# Altium schematic sheet PAGE05_ISO_RELAYS.SchDoc
size 386 x 246 mm
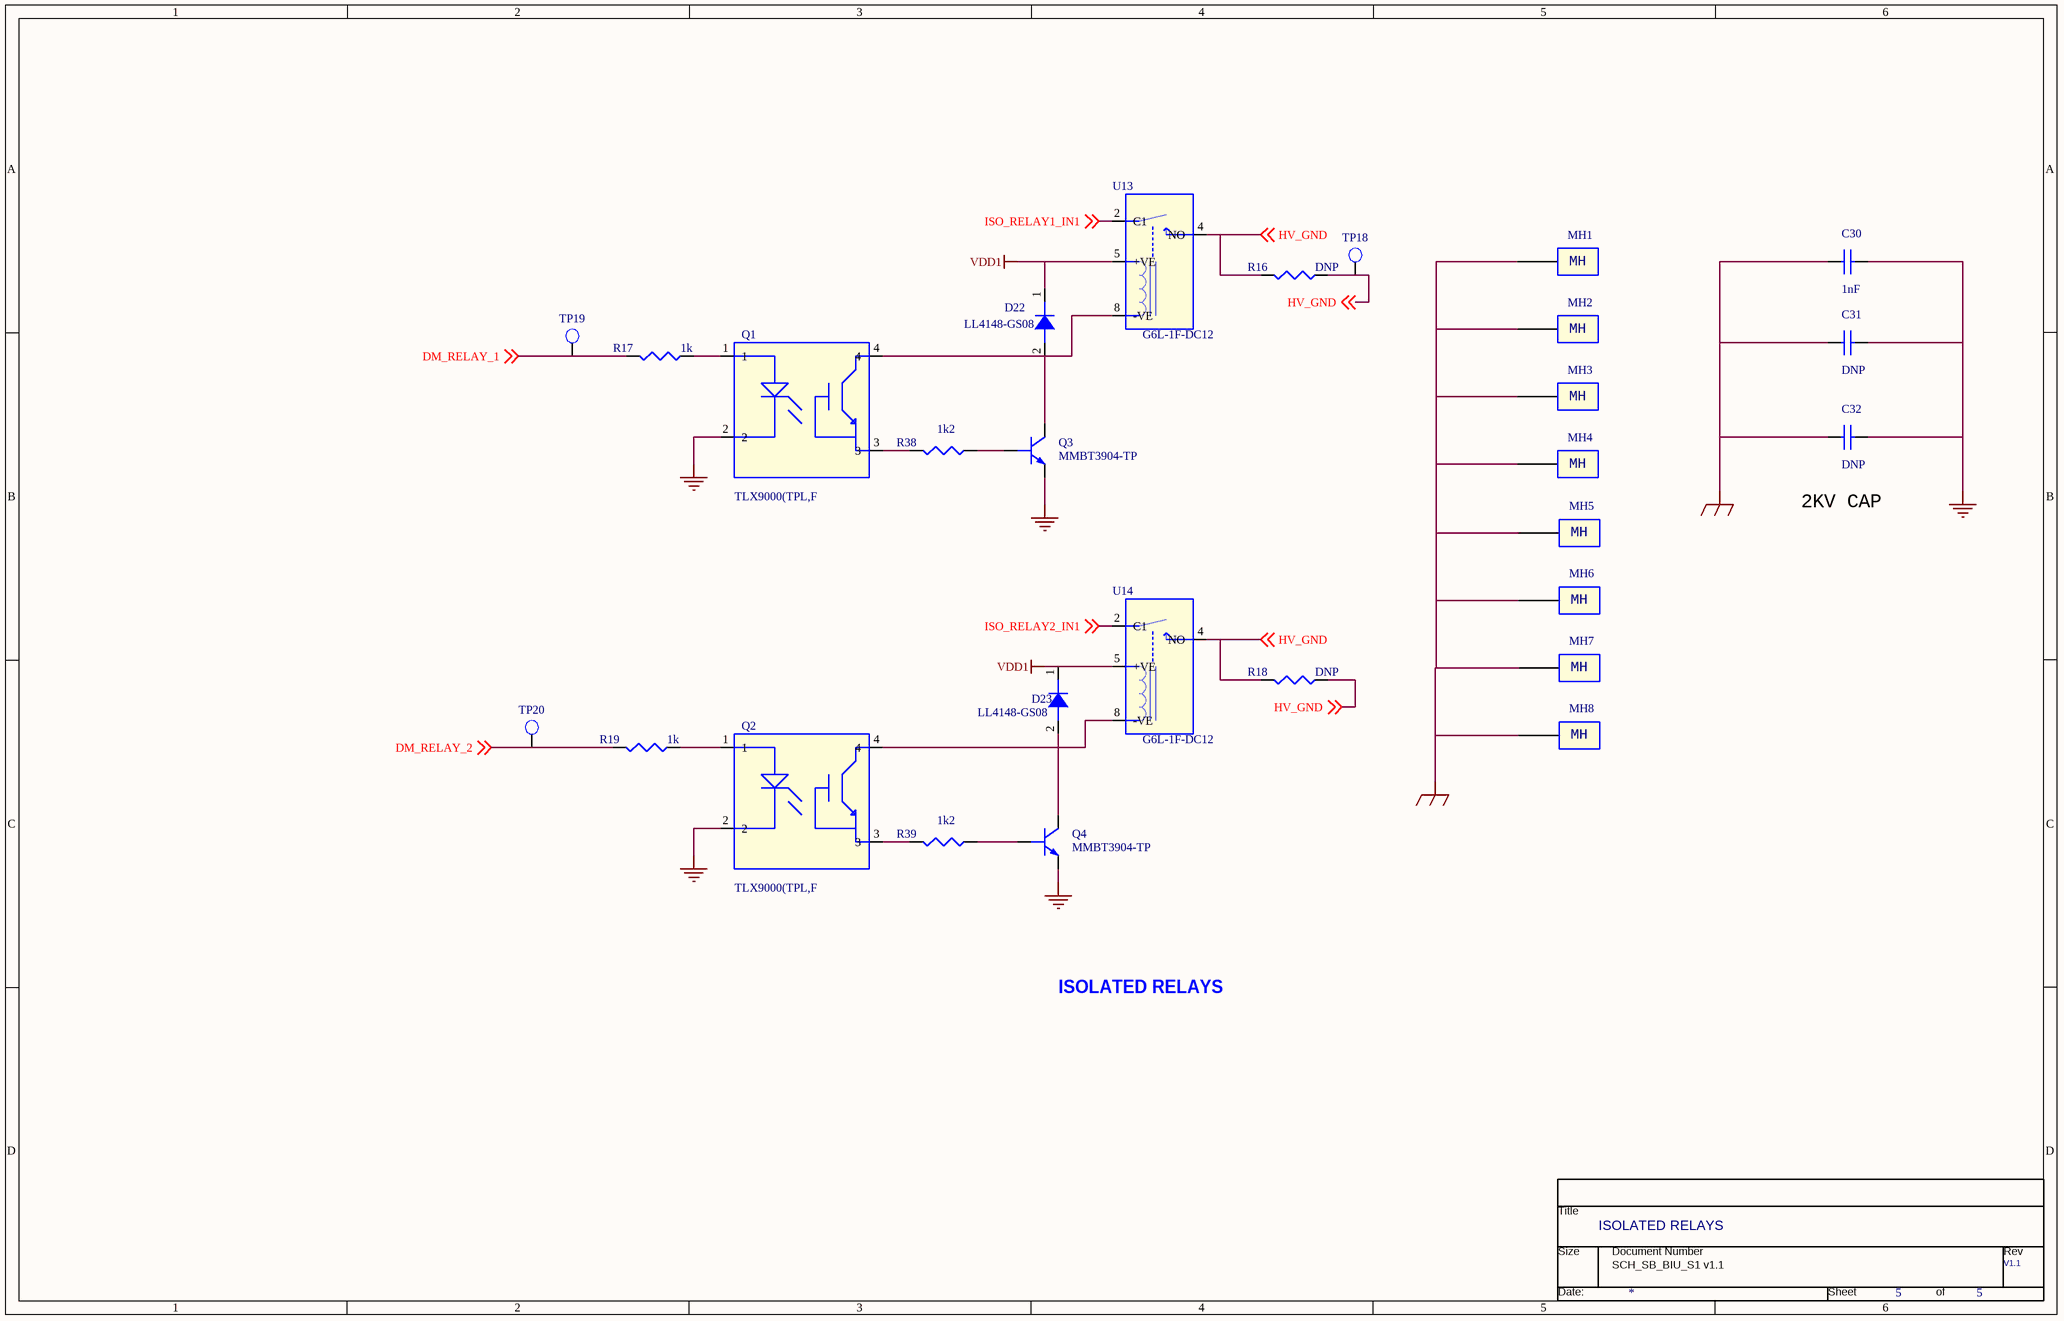
[diagram p0: PAGE05_ISO_RELAYS.SchDoc]

## Parts
*  Page Count: 5  Title: ISOLATED RELAYS  RevCode: V1.1  (hidden comment: TitleBlock0)  (graphical)
C30  1nF  [CAPC3216X180N_D]
C31  DNP  [CAPC3216X180N_D]
C32  DNP  [CAPC3216X180N_D]
D22  LL4148-GS08  [DIOMELF3515N]
D23  LL4148-GS08  [DIOMELF3515N]
MH1  Mounting hole  [MTG320_620]  (value not drawn)
MH2  Mounting hole  [MTG320_620]  (value not drawn)
MH3  Mounting hole  [MTG320_620]  (value not drawn)
MH4  Mounting hole  [MTG320_620]  (value not drawn)
MH5  Mounting hole  [MTG320_620]  (value not drawn)
MH6  Mounting hole  [MTG320_620]  (value not drawn)
MH7  Mounting hole  [MTG320_620]  (value not drawn)
MH8  Mounting hole  [MTG320_620]  (value not drawn)
Q1  TLX9000(TPL,F  [OPTO_TLP293_BL-TPL_E]
Q2  TLX9000(TPL,F  [OPTO_TLP293_BL-TPL_E]
Q3  MMBT3904-TP  [SOT95P237X122-3N_OSI]
Q4  MMBT3904-TP  [SOT95P237X122-3N_OSI]
R16  DNP  [RESC1608X55N_A]
R17  1k  [RESC1608X55N_A]
R18  DNP  [RESC1608X55N_A]
R19  1k  [RESC1608X55N_A]
R38  1k2  [RESC1608X55N_A]
R39  1k2  [RESC1608X55N_A]
TP18  T POINT R  [TPC160H100]  (value not drawn)
TP19  T POINT R  [TPC160H100]  (value not drawn)
TP20  T POINT R  [TPC160H100]  (value not drawn)
U13  G6L-1F-DC12  [RELAY_G6L-1F-DC12]
U14  G6L-1F-DC12  [RELAY_G6L-1F-DC12]

## Nets
CHASSIS_GND: C30.1 C31.1 C32.1 MH1.1 MH2.1 MH3.1 MH4.1 MH5.1 MH6.1 MH7.1 MH8.1
GND: C30.2 C31.2 C32.2 Q1.2 Q2.2 Q3.3(E) Q4.3(E)
VDD1: D22.1(K) D23.1(K) U13.5(+VE) U14.5(+VE)
DM_RELAY_1: R17.2 TP19.1(TP) ; off-sheet DM_RELAY_1
DM_RELAY_2: R19.2 TP20.1(TP) ; off-sheet DM_RELAY_2
HV_GND: R16.1 R16.2 R18.1 R18.2 TP18.1(TP) U13.4(NO) U14.4(NO) ; off-sheet HV_GND
ISO_RELAY1_IN1: U13.2(C1) ; off-sheet ISO_RELAY1_IN1
ISO_RELAY2_IN1: U14.2(C1) ; off-sheet ISO_RELAY2_IN1
NetD22_2: D22.2(A) Q1.4 Q3.2(C) U13.8(-VE)
NetD23_2: D23.2(A) Q2.4 Q4.2(C) U14.8(-VE)
NetQ1_1: Q1.1 R17.1
NetQ1_3: Q1.3 R38.2
NetQ2_1: Q2.1 R19.1
NetQ2_3: Q2.3 R39.2
NetQ3_1: Q3.1(B) R38.1
NetQ4_1: Q4.1(B) R39.1

## Notes on the sheet
- 2KV CAP
- ISOLATED RELAYS
- SCH_SB_BIU_S1 v1.1
- (in symbol Mounting hole) MH
- (in symbol TitleBlock0) Title; Size; Document Number; Rev; Date:; Sheet; of

## Library data of the parts
* = TitleBlock0: Page Size: A; Page Number: 5; Page Create Date: March  8, 1995; Page Modify Date: *
C30-C32 = CAPACITOR NON-POL: CAP CER 1000PF 2KV X7R 1206; Manufacturere's P/N: CL31B102KJHNNNE; Manufacturer: Samsung Electro-Mechanics; Manufacturer Part Number: CL31B102KJHNNNE; Package: 1206; PCB Footprint: CAPC3216X180N_D
D22 D23 = DIODE PIN_1: DIODE GEN PURP 75V 300MA SOD80; Manufacturer: Vishay Semiconductor; PCB Footprint: DIOMELF3515N; Package: SOD-80; Manufacturer Part Number: LL4148-GS08; Manufacturere's P/N: LL4148-GS08
Q1 Q2 = TLX9000TPLF_1: Transistor Output Optocouplers Transistor Coupler Automotive;; Manufacturer: Toshiba; Manufacturere's P/N: TLX9000(TPL,F; package: SO-4; PCB Footprint: OPTO_TLP293_BL-TPL_E
Q3 Q4 = NPN BCE: Manufacturer: Micro Commercial Co; PspiceTemplate: Q^@REFDES %C %B %E; Manufacturere's P/N: MMBT3904-TP; PCB Footprint: SOT95P237X122-3N_OSI
R16 R38 R39 = RES_57: Thick Film Resistors - SMD 1/10Watt 0ohms; Manufacturer Part Number: CRCW06030000Z0EAC; Manufacturer: Vishay / Dale; CLASS: DISCRETE; Package: 0603; ROHS: Yes; Manufacturere's P/N: CRCW06030000Z0EAC; PCB Footprint: RESC1608X55N_A
R17 R18 = RES_57: Thick Film Resistors - SMD 1/10Watt 0ohms; Manufacturere's P/N: CRCW06030000Z0EAC; Manufacturer: Vishay / Dale; CLASS: DISCRETE; ROHS: Yes; Package: 0603; PCB Footprint: RESC1608X55N_A
R19 = RES_57: Thick Film Resistors - SMD 1/10Watt 0ohms; Manufacturer: Vishay / Dale; Manufacturere's P/N: CRCW06030000Z0EAC; CLASS: DISCRETE; Package: 0603; ROHS: Yes; PCB Footprint: RESC1608X55N_A
U13 U14 = Relay_SPDT_b_0: Low Signal Relays - PCB LO PROF SPST 12VDC; Manufacturer: Omron Electronics; T_BOUNCE: 5mSec; T_MAKE: 20mSec; T_BREAK: 10mSec; I_PULL: 35ma; I_DROP: 25ma; R_COIL: 100; L_COIL: 5mH; R_OPEN: 100MEG; R_CLOSE: .05; PSpiceTemplate: X^@REFDES %A %B %NO %NC %COM @MODEL PARAMS:\n+ T_make=@T_MAKE\n+ T_break=@T_BREAK\n+ T_bounce=@T_BOUNCE\n+ I_pull=@I_PULL\n+ I_drop=@I_DROP\n+ R_coil=@R_COIL\n+ L_coil=@L_COIL\n+ R_open=@R_OPEN\n+ R_close=@R_CLOSE; Manufacturere's P/N: G6L-1F-DC12; PCB Footprint: RELAY_G6L-1F-DC12
MH1-MH8 = Mounting hole: PCB Footprint: MTG320_620
TP18-TP20 = T POINT R: PCB Footprint: TPC160H100